# Altium schematic sheet PowerSupply.SchDoc
size A4; SheetNumber: 7; SheetTotal: 8
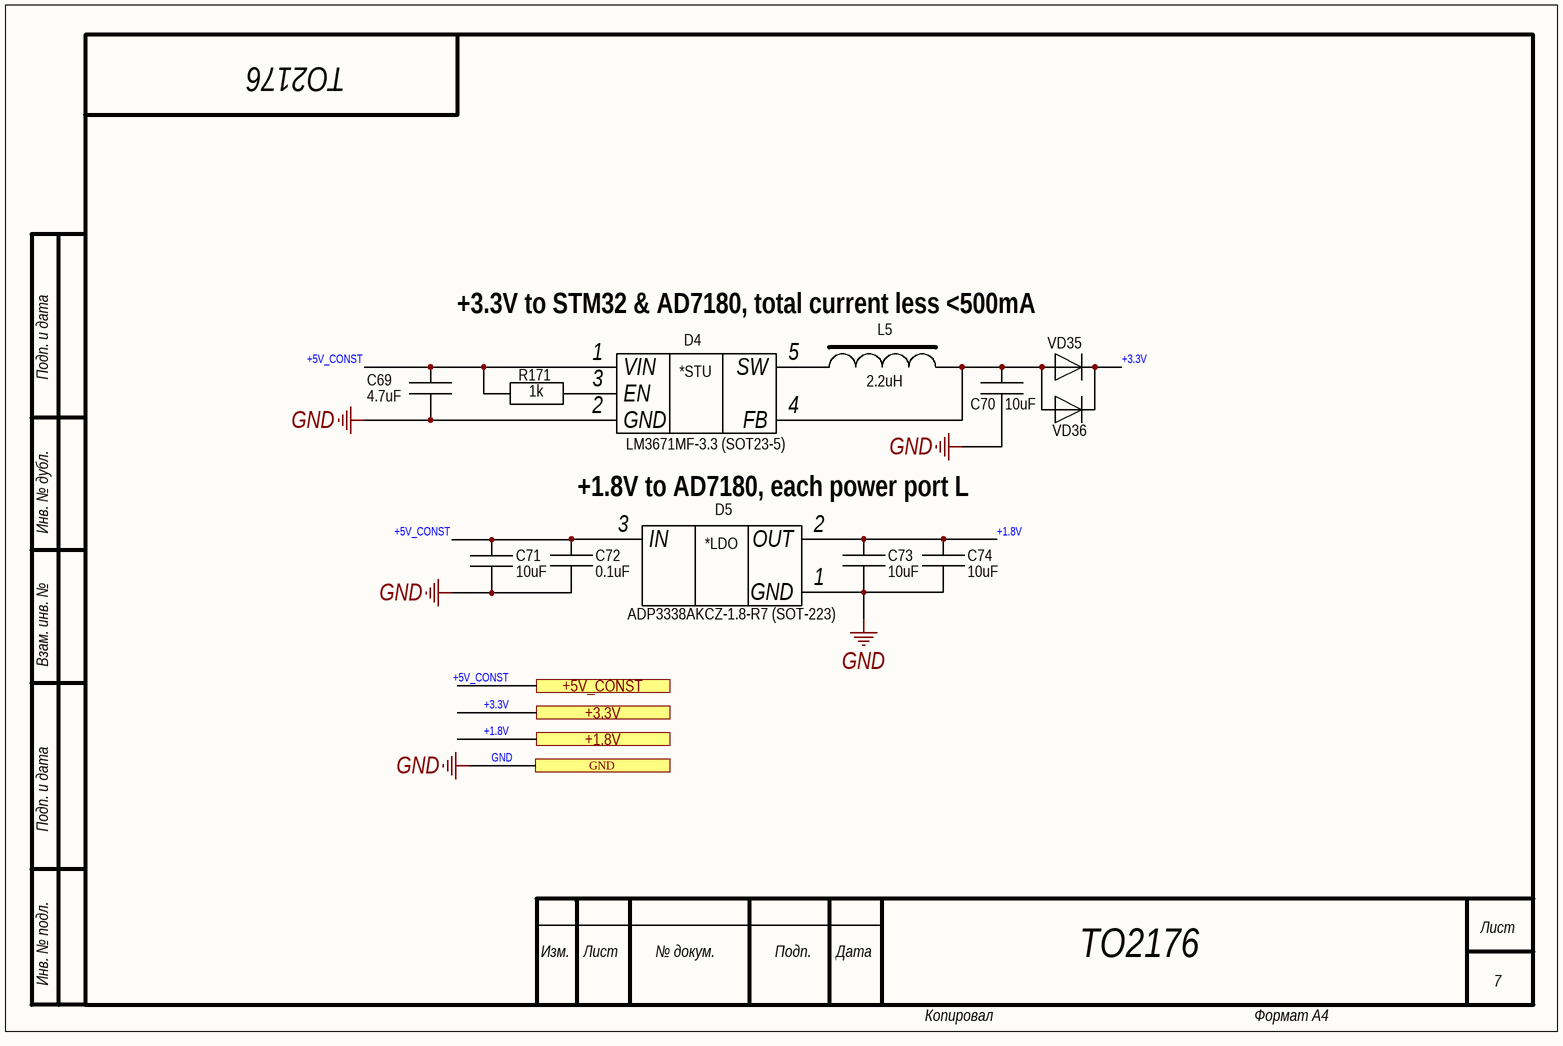
[diagram p0: PowerSupply.SchDoc]

## Parts
C69  4.7uF  [0603]
C70  10uF  [0603]
C71  10uF  [0603]
C72  0.1uF  [0603]
C73  10uF  [0603]
C74  10uF  [0603]
D4  LM3671MF-3.3 (SOT23-5)  [SOT-23-5]
D5  ADP3338AKCZ-1.8-R7 (SOT-223)  [SOT-223]
L5  2.2uH  [SRN3015 (3x3x1.5)]
R171  1k  [0603]
VD35  BAT60JFILM (SOD323)  [SOD323]  (value not drawn)
VD36  BAT60JFILM (SOD323)  [SOD323]  (value not drawn)

## Ports
+1.8V, +3.3V, +5V_CONST, GND

## Nets
GND: C69.2 C70.2 C71.2 C72.2 C73.2 C74.2 D4.2(GND) D5.1(GND) ; port GND
+1.8V: C73.1 C74.1 D5.2(OUT) ; port +1.8V
+3.3V: VD35.2(K) VD36.2(K) ; port +3.3V
+5V_CONST: C69.1 C71.1 C72.1 D4.1(VIN) D5.3(IN) R171.1 ; port +5V_CONST
NetC70_1: C70.1 D4.4(FB) L5.2 VD35.1(A) VD36.1(A)
NetD4_3: D4.3(EN) R171.2
NetD4_5: D4.5(SW) L5.1

## Notes on the sheet
- ТО2176
- +3.3V to STM32 & AD7180, total current less <500mA
- Подп. и дата
- +1.8V to AD7180, each power port L
- Инв. № дубл.
- Взам. инв. №
- Инв. № подл.
- Изм.
- Лист
- № докум.
- Подп.
- Дата
- 7
- Копировал
- Формат А4
- Перв. примен.
- Справ. №
- Разраб.
- Литера
- Масса
- Масштаб
- Пров.
- Т.контр.
- Листов
- Н.контр.
- Утв.
- Форма 1 ГОСТ 2.104-2006
- (in symbol ADP3338 (SOT-223)) *LDO
- (in symbol LM3671MF (SOT23-5)) *STU

## Library data of the parts
C69 = C0603: 4.7uF,16V (0603); ComponentHeigt: 1.3; Firme: AVX; Leadform: SMD; KIND: Конденсатор; ClassName: *; Component Link: *; ComponentWeigt: *; Packaging: 0805; NN: *; Value: *
C70 C71 C74 = C0603: 10uF,16V (0603); ComponentHeigt: 1.3; Firme: AVX; Leadform: SMD; KIND: Конденсатор; ClassName: *; Component Link: *; ComponentWeigt: *; Packaging: 0805; NN: *; Value: *
C72 C73 = C0603: 0.1uF,50V (0603); ComponentHeigt: 1.3; Firme: AVX; Leadform: SMD; KIND: Конденсатор; ClassName: *; Component Link: *; ComponentWeigt: *; Packaging: 0805; NN: *; Value: *
D4 = LM3671MF (SOT23-5): ComponentHeigt: 1.8; Firme: Linear; Leadform: формована; Kind: Микросхема; ClassName: *; Component Link: *; Packaging: SOT-223; NN: *
D5 = ADP3338 (SOT-223): ComponentHeigt: 1.8; Firme: Linear; Leadform: формована; Kind: Микросхема; ClassName: *; Component Link: *; Packaging: SOT-223; NN: *
L5 = SRN3015 (3x3x1.5): SRN3015-2R2M (2.2uH,1A); Value: {Value}; ComponentHeigt: 3.2; Firm: TDK; Name: Катушка индуктивности; Kind: Катушка индуктивности B82432T TDK; Typ: B82432T; NN: *; Packaging: SIMIT 1812-T
R171 = R0603 Yageo: ComponentHeigt: 0.5; Leadform: SMD; Firme: Yageo; Kind: Резистор; Packaging: 0402; ClassName: *; Component Link: *; NN: *
VD35 VD36 = BAT60JFILM (SOD323): ComponentHeigt: 0.75; Leadform: в отверстия; Firme: Kingbright; NN: 24003000; KIND: Светодиод L-1154GD Kingbright; Component Link: *; ClassName: *